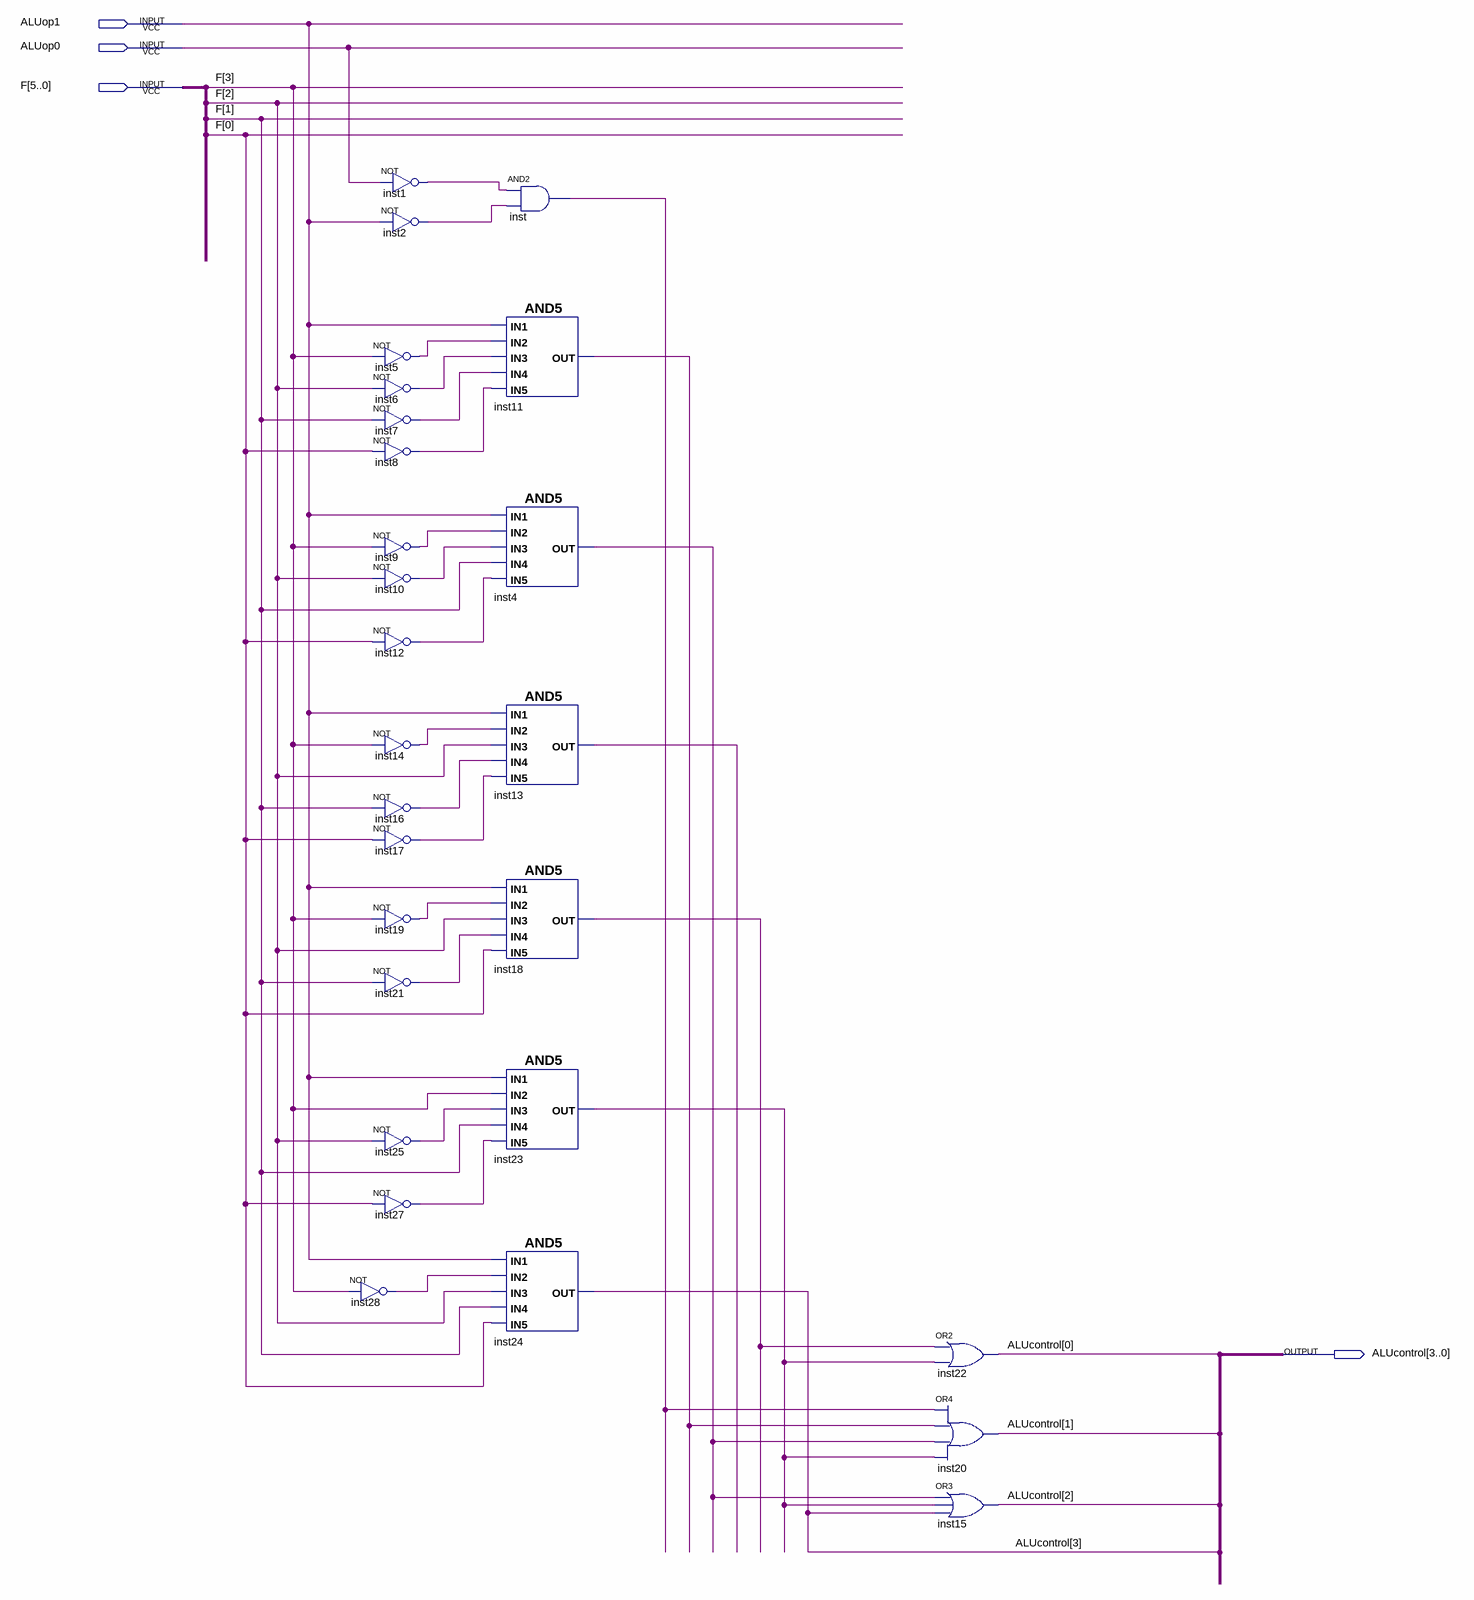
[diagram p0: schematic sheet]
// Quartus schematic ALU_Control.bdf as structural Verilog: 27 symbols, 4 pins
module ALU_Control (
  input  ALUop1,
  input  ALUop0,
  input  [5:0] F,
  output [3:0] ALUcontrol
);

  wire inst1_out, inst2_out, inst4_out, inst5_out, inst6_out, inst7_out, inst8_out, inst9_out, inst10_out,
       inst11_out, inst12_out, inst13_out, inst14_out, inst16_out, inst17_out, inst18_out, inst19_out,
       inst21_out, inst23_out, inst25_out, inst27_out, inst28_out, inst_out;

  not inst28 (inst28_out, F[3]);
  not inst1 (inst1_out, ALUop0);
  not inst2 (inst2_out, ALUop1);
  not inst5 (inst5_out, F[3]);
  not inst6 (inst6_out, F[2]);
  not inst7 (inst7_out, F[1]);
  not inst8 (inst8_out, F[0]);
  not inst9 (inst9_out, F[3]);
  not inst10 (inst10_out, F[2]);
  not inst12 (inst12_out, F[0]);
  not inst14 (inst14_out, F[3]);
  not inst16 (inst16_out, F[1]);
  not inst17 (inst17_out, F[0]);
  not inst19 (inst19_out, F[3]);
  not inst21 (inst21_out, F[1]);
  not inst25 (inst25_out, F[2]);
  not inst27 (inst27_out, F[0]);
  and inst (inst_out, inst1_out, inst2_out);
  and inst11 (inst11_out, ALUop1, inst5_out, inst6_out, inst7_out, inst8_out);
  and inst4 (inst4_out, ALUop1, inst9_out, inst10_out, F[1], inst12_out);
  and inst13 (inst13_out, ALUop1, inst14_out, F[2], inst16_out, inst17_out);
  and inst18 (inst18_out, ALUop1, inst19_out, F[2], inst21_out, F[0]);
  and inst23 (inst23_out, ALUop1, F[3], inst25_out, F[1], inst27_out);
  and inst24 (ALUcontrol[3], ALUop1, inst28_out, F[2], F[1], F[0]);
  or inst22 (ALUcontrol[0], inst18_out, inst23_out);
  or inst20 (ALUcontrol[1], inst_out, inst11_out, inst4_out, inst23_out);
  or inst15 (ALUcontrol[2], inst4_out, inst23_out, ALUcontrol[3]);
endmodule
